# Altium project smoke_detector.PrjPcb
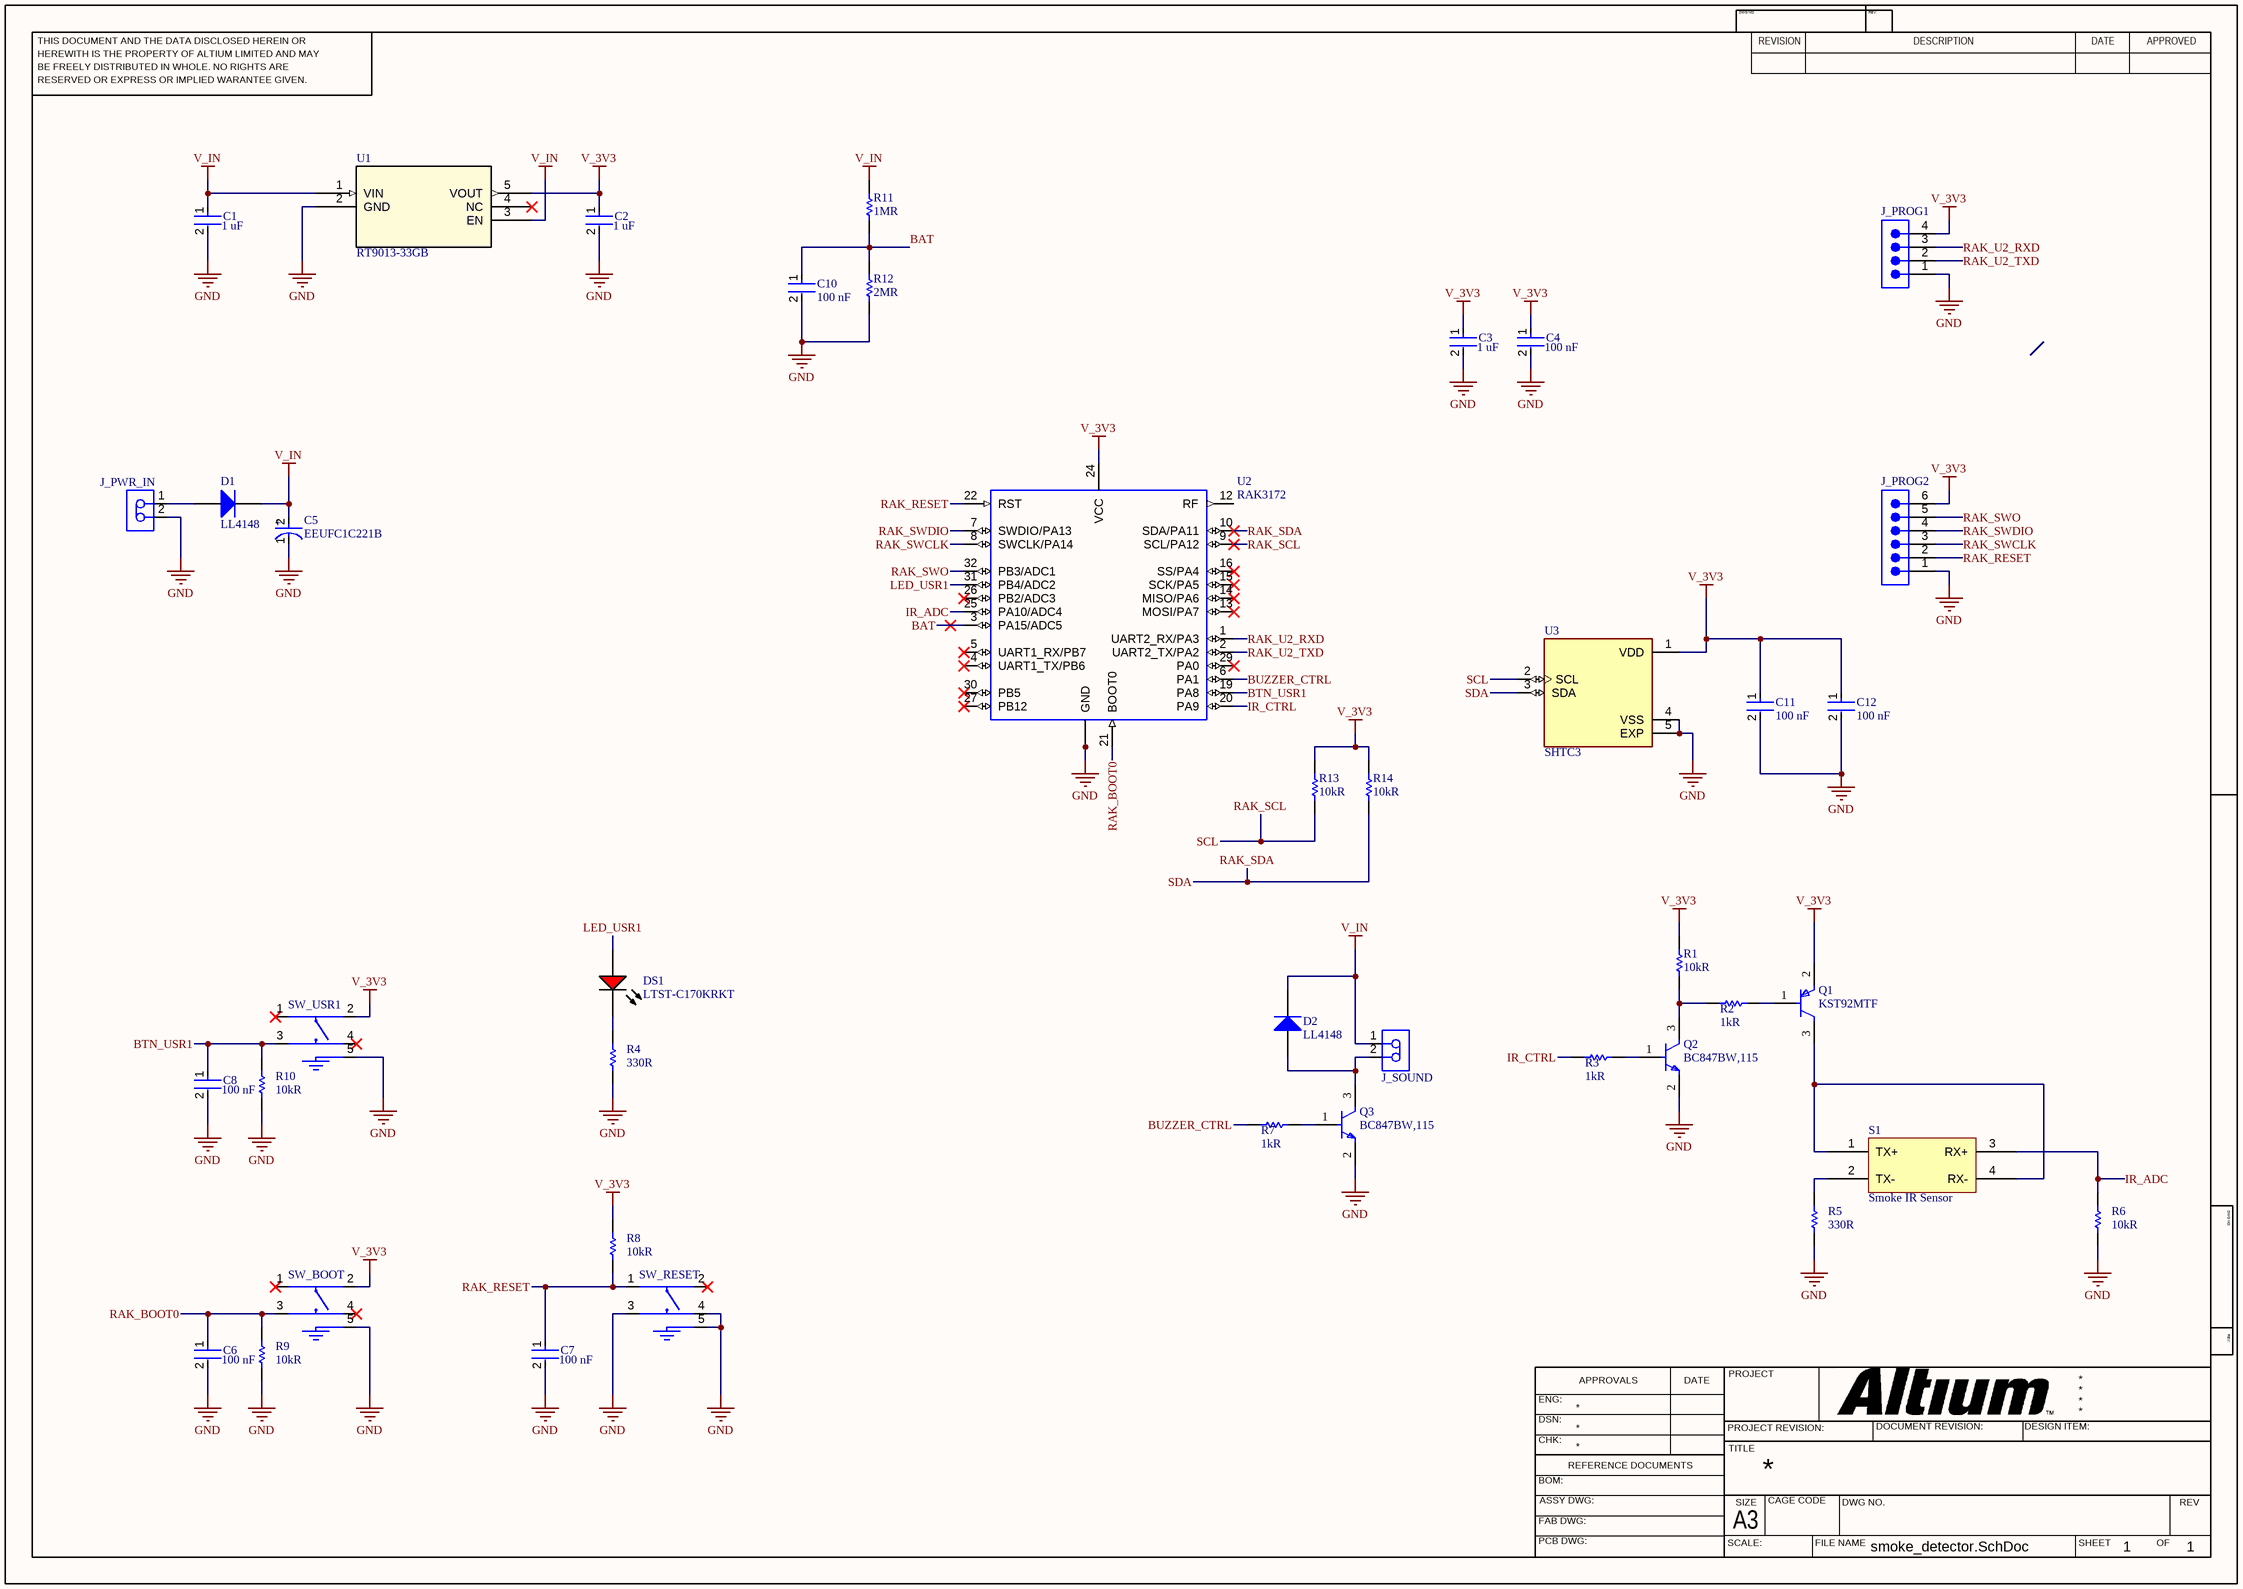
[diagram p0: smoke_detector.SchDoc]
1 sheet, 42 parts. Net scope: global (net labels, ports and power ports of the same name join across sheets).
Board file: smoke_detector.PcbDoc

## Sheet smoke_detector.SchDoc
size 420 x 297 mm; SheetNumber: 1; SheetTotal: 1

### Parts
C1  value 1 uF  [FP-CC0805-0_85-MFG]  (hidden comment: CC0805KFX7R7BB105)
C2  value 1 uF  [FP-CC0805-0_85-MFG]  (hidden comment: CC0805KFX7R7BB105)
C3  value 1 uF  [FP-CC0805-0_85-MFG]  (hidden comment: CC0805KFX7R7BB105)
C4  value 100 nF  [FP-CC0805-0_85-MFG]  (hidden comment: CC0805KRX7R7BB104)
C5  EEUFC1C221B  [FP-RAD-TH-D_8_0_5-L_11_5-MFG]
C6  value 100 nF  [FP-CC0805-0_85-MFG]  (hidden comment: CC0805KRX7R7BB104)
C7  value 100 nF  [FP-CC0805-0_85-MFG]  (hidden comment: CC0805KRX7R7BB104)
C8  value 100 nF  [FP-CC0805-0_85-MFG]  (hidden comment: CC0805KRX7R7BB104)
C10  value 100 nF  [FP-CC0805-0_85-MFG]  (hidden comment: CC0805KRX7R7BB104)
C11  value 100 nF  [FP-CC0805-0_85-MFG]  (hidden comment: CC0805KRX7R7BB104)
C12  value 100 nF  [FP-CC0805-0_85-MFG]  (hidden comment: CC0805KRX7R7BB104)
D1  LL4148  [FAIR-SOD80-2_V]
D2  LL4148  [FAIR-SOD80-2_V]
DS1  LTST-C170KRKT  [LTST-C170KRKT_V]
J_PROG1  61300411121  [61300411121]  (value not drawn)
J_PROG2  61300611121  [61300611121]  (value not drawn)
J_PWR_IN  B2B-PH-K-S(LF)(SN)  [JST-B2B-PH-K-S_V]  (value not drawn)
J_SOUND  B2B-PH-K-S(LF)(SN)  [JST-B2B-PH-K-S_V]  (value not drawn)
Q1  KST92MTF  [FP-318BM-MFG]
Q2  BC847BW,115  [FP-SOT323-MFG]
Q3  BC847BW,115  [FP-SOT323-MFG]
R1  value 10kR  [RESC2013X60X30LL20T20]  (hidden comment: SG73S2ATTD1002F)
R2  value 1kR  [RESC2013X60X35LL10T20]  (hidden comment: RC0805JR-131KL)
R3  value 1kR  [RESC2013X60X35LL10T20]  (hidden comment: RC0805JR-131KL)
R4  value 330R  [RESC2013X70X40ML20T20]  (hidden comment: ERJ-6GEYJ331V)
R5  value 330R  [RESC2013X70X40ML20T20]  (hidden comment: ERJ-6GEYJ331V)
R6  value 10kR  [RESC2013X60X30LL20T20]  (hidden comment: SG73S2ATTD1002F)
R7  value 1kR  [RESC2013X60X35LL10T20]  (hidden comment: RC0805JR-131KL)
R8  value 10kR  [RESC2013X60X30LL20T20]  (hidden comment: SG73S2ATTD1002F)
R9  value 10kR  [RESC2013X60X30LL20T20]  (hidden comment: SG73S2ATTD1002F)
R10  value 10kR  [RESC2013X60X30LL20T20]  (hidden comment: SG73S2ATTD1002F)
R11  value 1MR  [RESC2013X60X30LL20T20]  (hidden comment: SG73S2ATTD1002F)
R12  value 2MR  [RESC2013X60X30LL20T20]  (hidden comment: SG73S2ATTD1002F)
R13  value 10kR  [RESC2013X60X30LL20T20]  (hidden comment: SG73S2ATTD1002F)
R14  value 10kR  [RESC2013X60X30LL20T20]  (hidden comment: SG73S2ATTD1002F)
S1  Smoke IR Sensor  [smoke_ir_sensor_1]
SW_BOOT  tactile_6_by_6_mm  [tactile_6_by_6_mm]  (value not drawn)
SW_RESET  tactile_6_by_6_mm  [tactile_6_by_6_mm]  (value not drawn)
SW_USR1  tactile_6_by_6_mm  [tactile_6_by_6_mm]  (value not drawn)
U1  RT9013-33GB  [SOT-23-5_RIT]
U2  RAK3172  [RAK3172]
U3  SHTC3  [SON100P200X200X80-5N]

### Nets
GND: C1.2 C2.2 C3.2 C4.2 C5.1(C) C6.2 C7.2 C8.2 C10.2 C11.2 C12.2 J_PROG1.1 J_PROG2.1 J_PWR_IN.2 Q2.2(E) Q3.2(E) R4.1 R5.1 R6.1 R9.1 R10.1 R12.1 SW_BOOT.5 SW_RESET.3 SW_RESET.4 SW_RESET.5 SW_USR1.5 U1.2(GND) U2.11(GND) U2.17(GND) U2.18(GND) U2.23(GND) U2.28(GND) U3.4(VSS) U3.5(EXP)
V_3V3: C2.1 C3.1 C4.1 C11.1 C12.1 J_PROG1.4 J_PROG2.6 Q1.2(E) R1.1 R8.2 R13.2 R14.2 SW_BOOT.2 SW_USR1.2 U1.5(VOUT) U2.24(VCC) U3.1(VDD)
V_IN: C1.1 C5.2(A) D1.2(K) D2.2(K) J_SOUND.1 R11.2 U1.1(VIN) U1.3(EN)
BAT: C10.1 R11.1 R12.2 U2.3(PA15/ADC5)
BTN_USR1: C8.1 R10.2 SW_USR1.3 U2.19(PA8)
BUZZER_CTRL: R7.1 U2.6(PA1)
IR_ADC: R6.2 S1.3(RX+) U2.25(PA10/ADC4)
IR_CTRL: R3.1 U2.20(PA9)
LED_USR1: DS1.1(A) U2.31(PB4/ADC2)
RAK_BOOT0: C6.1 R9.2 SW_BOOT.3 U2.21(BOOT0)
RAK_RESET: C7.1 J_PROG2.2 R8.1 SW_RESET.1 U2.22(RST)
RAK_SCL: R13.1 U2.9(SCL/PA12) U3.2(SCL)  [also labelled SCL]
RAK_SDA: R14.1 U2.10(SDA/PA11) U3.3(SDA)  [also labelled SDA]
RAK_SWCLK: J_PROG2.3 U2.8(SWCLK/PA14)
RAK_SWDIO: J_PROG2.4 U2.7(SWDIO/PA13)
RAK_SWO: J_PROG2.5 U2.32(PB3/ADC1)
RAK_U2_RXD: J_PROG1.3 U2.1(UART2_RX/PA3)
RAK_U2_TXD: J_PROG1.2 U2.2(UART2_TX/PA2)
NetD1_1: D1.1(A) J_PWR_IN.1
NetD2_1: D2.1(A) J_SOUND.2 Q3.3(C)
NetDS1_2: DS1.2(K) R4.2
NetQ1_1: Q1.1(B) R2.2
NetQ1_3: Q1.3(C) S1.1(TX+) S1.4(RX-)
NetQ2_1: Q2.1(B) R3.2
NetQ2_3: Q2.3(C) R1.2 R2.1
NetQ3_1: Q3.1(B) R7.2
NetR5_2: R5.2 S1.2(TX-)

Not connected (* = marked no-connect by the designer): SW_BOOT 1* 4*; SW_RESET 2*; SW_USR1 1* 4*; U1 4(NC)*; U2 4(UART1_TX/PB6)* 5(UART1_RX/PB7)* 12(RF) 13(MOSI/PA7)* 14(MISO/PA6)* 15(SCK/PA5)* 16(SS/PA4)* 26(PB2/ADC3)* 27(PB12)* 29(PA0)* 30(PB5)*

### Notes on the sheet
- THIS DOCUMENT AND THE DATA DISCLOSED HEREIN OR
- HEREWITH IS THE PROPERTY OF ALTIUM LIMITED AND MAY
- DWG NO:
- REVISION
- REV:
- DESCRIPTION
- DATE
- APPROVED
- BE FREELY DISTRIBUTED IN WHOLE. NO RIGHTS ARE
- RESERVED OR EXPRESS OR IMPLIED WARANTEE GIVEN.
- ENG:
- APPROVALS
- PROJECT
- DSN:
- CHK:
- REFERENCE DOCUMENTS
- PROJECT REVISION:
- TITLE
- DOCUMENT REVISION:
- DESIGN ITEM:
- BOM:
- FAB DWG:
- PCB DWG:
- ASSY DWG:
- SCALE:
- A3
- SIZE
- CAGE CODE
- FILE NAME
- DWG NO.
- SHEET
- OF
- REV
- (in symbol CMP-05427-002014-1) +

### Library data of the parts
C1-C3 = CMP-03422-000058-1: CC0805 1 uF X7R 10.00% 16 V; Manufacturer: Yageo; Material: Ceramic; Tolerance: 0.1; Voltage Rating: 16 V; ComponentLink2URL: http://www.yageo.com/documents/recent/UPY-GPHC_Y5V_6.3V-to-50V_8.pdf; Capacitance: 1 uF; Octopart: https://octopart.com/cc0805kfx7r7bb105-yageo-30261725; Footprint Url: http://www.yageo.com/exep/pages/download/literatures/UPY-C_GEN_24.pdf; ComponentLink2Description: Datasheet; Ipc Land Pattern Name: CAPC200125X85; Category: Cap; Device Class L1: Passive Components; Temperature Range High: +85°C; Mouser Description: Multilayer Ceramic Capacitors MLCC - SMD/SMT 1.0uF 16V X7R 10%; Height: 0.95mm; Automotive: No; Device Class L3: Ceramic Capacitors; Temperature: -30°C to +85°C; Temperature Range Low: -30°C; Temperature Characteristic: X7R; Device Class L2: Capacitors; Lead Free: Yes; Manufacturer Part Number: CC0805KFX7R7BB105; RoHS: TRUE; Package: CC0805-0.85
C4 C6-C8 C10-C12 = CMP-1036-04402-6: CAP CER 0.1UF 16V X7R 0805; Manufacturer: Yageo; Material: Ceramic; Tolerance: 0.1; Manufacturer Part Number: CC0805KRX7R7BB104; Temperature: -30°C to +85°C; Lead Free: Yes; Footprint Url: http://www.yageo.com/exep/pages/download/literatures/UPY-C_GEN_24.pdf; Voltage Rating: 16 V; Package: CC0805-0.85; RoHS: TRUE; Digikey Description: CAP CER 0.1UF 16V X7R 0805; Category: Cap; Octopart: https://octopart.com/cc0805krx7r7bb104-yageo-39467769; Capacitance: 100 nF; Device Class L3: Ceramic Capacitors; ComponentLink2URL: http://www.yageo.com/documents/recent/UPY-GPHC_Y5V_6.3V-to-50V_8.pdf; Temperature Range Low: -30°C; Mouser Description: Multilayer Ceramic Capacitors MLCC - SMD/SMT 100nF 16V X7R 10%; Automotive: No; Device Class L2: Capacitors; Height: 0.95mm; ComponentLink2Description: Datasheet; Temperature Characteristic: X7R; Ipc Land Pattern Name: CAPC200125X85; Device Class L1: Passive Components; Temperature Range High: +85°C
C5 = CMP-05427-002014-1: Aluminum Electrolytic Capacitors (Radial Lead Type) AEC-Q200 Qualified 220uF ±20% 16V; Polarity: Polar; Life (Hours): 2000Hour; Ripple Current: 555mA; Impedance: 117mR; Lead Diameter: 0.6mm; Package Quantity: 1000; Lead Pitch: 5mm; Radiation Hardening: No; Mount: Through Hole; Voltage Rating: 16V; RoHS Compliant: Yes; Diameter: 8mm; Length: 11mm; Max Operating Temperature: 105°C; Termination: Radial; Height: 11.5mm; Capacitance: 220uF; Ratings: AEC-Q200; Packaging: Ammo Pack; Height - Seated (Max): 0.492inch; Voltage Rating (DC): 16V; Min Operating Temperature: -55°C; Series: FC; Tolerance: 20%; Case/Package: Radial
D1 D2 = CMP-2000-05115-2: Small Signal Diode, 100 V, 0.2 A, -55 to 175 degC, 2-Pin SOD80, RoHS, Tape and Reel; Manufacturer: Fairchild; Reverse Voltage-Max [Vrrm]: 100V; Average Forward Current-Max: 200mA; Forward Voltage: 1V; Reverse Recovery Time-Max: 1ns; Power Dissipation: 500mW; Datasheet URL: https://www.fairchildsemi.com/datasheets/LL/LL4148.pdf; Manufacturer URL: https://www.fairchildsemi.com/; Datasheet Version: Rev. 1.8, 01/2016
DS1 = CMP-2000-07593-1: LED Red, 75 mW, 54 mcd, -55 to 85 degC, 2-Pin SMD, RoHS, Tape and Reel; Manufacturer: Lite-On; Lens Transparency: Clear; Number of Elements: 1; Power Rating: 75mW; Luminous Intensity: 54mcd; Viewing Angle: 130degrees; Forward Current: 30mA; Wavelength: 639nm; Lens Style: Rectangular; Case\/Package: 0805; Test Current: 20mA; Dominant Wavelength: 631nm; Forward Voltage: 2V; Lens Colour: Colorless; Min Operating Temperature: -55degC; RoHSCompliant: True; Length: 3.2mm; Width: 1.25mm; Mount: SurfaceMount; Packaging: TapeandReel; Number of LEDs: 1; Radiation Hardening: No; Datasheet URL: http://optoelectronics.liteon.com/upload/download/DS-22-99-0150/LTST-C170KRKT.pdf; Datasheet Version: Rev. D, 11/2014; Case Code (Metric): 2012; Height: 1.1mm; Number of Pins: 2; Package Description: 2-Pin Surface Mount Device, Body 2 x 1.25 mm; Manufacturer URL: http://www.us.liteon.com/; Lead Free: LeadFree; Illumination Colour: Red; Colour: Red; Case Code (Imperial): 0805; Max Operating Temperature: 85degC; Power Dissipation: 75mW; Mounting Technology: SurfaceMount; Package Reference: C170KRKT; Package Quantity: 1; Depth: 1.6mm
J_PROG1 = CMP-1502-01064-3: NexarPartId: 32855522; Operating Supply Voltage: 250V; Pitch: 2.54mm; Contact Resistance: 20mΩ; Number of Positions: 4; Current Rating: 3A; Connector Type: Male Pin; Gender: Male; Contact Plating: Gold; Height: 8.89mm; Lead Pitch: 2.54mm; Lead Free: Lead Free; Contact Mating Length: 5.9944mm; Number of Rows: 1; Termination: Solder; Packaging: Bulk; REACH SVHC: Unknown; Min Operating Temperature: -40°C; RoHS: Compliant; Number of Contacts: 4; Voltage Rating: 250V; Color: Black; Max Operating Temperature: 105°C; Contact Material: Copper; Mount: Through Hole; Orientation: Vertical; Number of Pins: 4
J_PROG2 = CMP-1502-01070-3: NexarPartId: 20084590; Current Rating: 3A; Pitch: 2.54mm; Gender: Male; Operating Supply Voltage: 250V; Connector Type: Male Pin; Number of Positions: 6; Contact Resistance: 20mΩ; Packaging: Bulk; Number of Pins: 6; Number of Rows: 1; Contact Plating: Gold; Lead Free: Lead Free; RoHS: Compliant; Contact Mating Length: 5.9944mm; Voltage Rating: 250V; REACH SVHC: Unknown; Contact Gender: Male; Housing Material: PBT; Min Operating Temperature: -40°C; Lead Pitch: 2.54mm; Mount: Through Hole; Number of Contacts: 6; Max Operating Temperature: 105°C; Contact Material: Copper; Orientation: Vertical; Termination: Through Hole; Color: Black; Height: 8.89mm
J_PWR_IN J_SOUND = CMP-2000-05162-1: Male Header, Pitch 2 mm, 1 x 2 Position, Height 6 mm, Tail Length 3.4 mm, -25 to 85 degC, RoHS, Bulk; Manufacturer: JST; Pitch: 2mm; Style/Orientation: StraightHeader/Plug; No of Positions: 2; Datasheet Version: Nov-08; Datasheet URL: http://datasheet.octopart.com/B2B-PH-K-S%28LF%29%28SN%29-JST-datasheet-8324864.pdf; Manufacturer URL: http://www.jst.com/home2.html; Type: ShroudedHeader; Termination: Crimp
Q1 = CMP-00278-84329678-1: KST92MTF Trans Gp Bjt PNP 300V 0.5A 250MW 3-PIN SOT-23 T/r / Trans PNP 300V 0.5A SOT23; Manufacturer Lifecycle Status: OBSOLETE; Max Collector Current: -500mA; hFE Min: 25; Power Dissipation: 350mW; Max Frequency: 50MHz; Current: 5A; Voltage: 200V; Collector Emitter Saturation Voltage: -500mV; Collector Emitter Voltage (VCEO): -300V; Emitter Base Voltage (VEBO): -5V; Element Configuration: Single; Max Junction Temperature (Tj): 150°C; Number of Elements: 1; Number of Pins: 3; Max Breakdown Voltage: 300V; Length: 2.9mm; Lead Free: Lead Free; RoHS: Compliant; Radiation Hardening: No; NexarPartId: 84329678; Current Rating: -500mA; Min Operating Temperature: -55°C; Max Operating Temperature: 150°C; Gain Bandwidth Product: 50MHz; Max Power Dissipation: 250mW; Width: 1.3mm; Schedule B: 8541210080; Mount: Surface Mount; Voltage Rating (DC): -300V; Collector Emitter Breakdown Voltage: -300V; Weight: 59.987591mg; REACH SVHC: No SVHC; Polarity: PNP; Lifecycle Status: Obsolete; Case/Package: SOT-23; Collector Base Voltage (VCBO): -300V; Frequency: 50MHz; Packaging: Cut Tape; Height: 1.2mm; Transition Frequency: 50MHz
Q2 Q3 = CMP-14406-000044-1: TRANS NPN 45V 100MA SOT323; RoHS Compliant: Yes
R1 R6 R8-R14 = CMP-2001-02616-1: Manufacturer: KOA Speer; Part Number: SG73S2ATTD1002F
R2 R3 R7 = CMP-2001-01418-1: Manufacturer: Yageo; Part Number: RC0805JR-131KL
R4 R5 = CMP-1013-00062-2: Manufacturer: Panasonic; Part Number: ERJ-6GEYJ331V
S1 = smoke_ir_sensor_1
U1 = RT9013-33GB: No Description Available; Manufacturer_Name: Richtek Technology; Copyright: Copyright (C) 2025 Ultra Librarian. All rights reserved.; Manufacturer_Part_Number: RT9013-33GB; RefDes: RefDes; Type: Type
U2 = RAK3172: RAK3172 is a low-power long-range transceiver module based on the STM32WLE5CC chip. It provides an easy-to-use, small-size, low-power solution for long range wireless data applications; MF: Shenzhen RAKwireless Technology Co.,Ltd.; MP: RAK3172; Value: *; Check_prices: https://www.snapeda.com/parts/RAK3172/Shenzhen+RAKwireless+Technology+Co.%252CLtd./view-part/?ref=eda; Package: Package; Price: None; Availability: Not in stock; SnapEDA_Link: https://www.snapeda.com/parts/RAK3172/Shenzhen+RAKwireless+Technology+Co.%252CLtd./view-part/?ref=snap
U3 = SHTC3: SENSOR HUMI/TEMP I2C 2% SMD; MF: Sensirion AG; SnapEDA_Link: https://www.snapeda.com/parts/SHTC3/Sensirion/view-part/?ref=snap; Package: DFN-4 Sensirion; Value: *; MP: SHTC3; Check_prices: https://www.snapeda.com/parts/SHTC3/Sensirion/view-part/?ref=eda